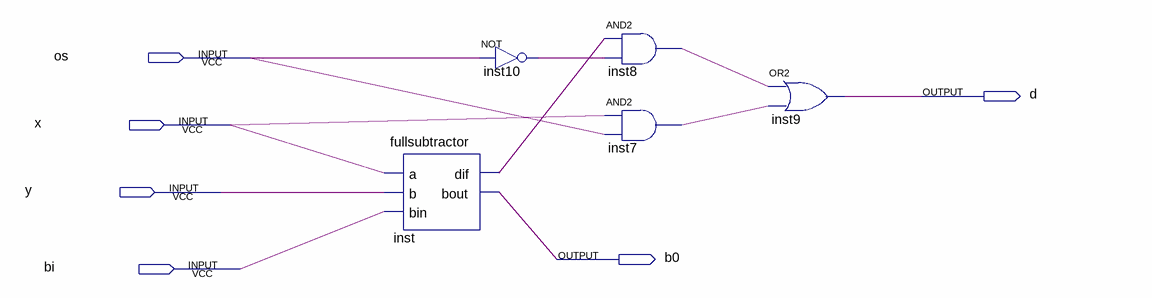
[diagram p0: schematic sheet]
// Quartus schematic csm.bdf as structural Verilog: 5 symbols, 6 pins
module csm (
  input  os,
  input  x,
  input  y,
  input  bi,
  output d,
  output b0
);

  wire inst7_out, inst8_out, inst10_out, inst_dif;

  fullsubtractor inst (.a(x), .b(y), .bin(bi), .dif(inst_dif), .bout(b0));
  not inst10 (inst10_out, os);
  and inst8 (inst8_out, inst_dif, inst10_out);
  and inst7 (inst7_out, x, os);
  or inst9 (d, inst8_out, inst7_out);
endmodule
